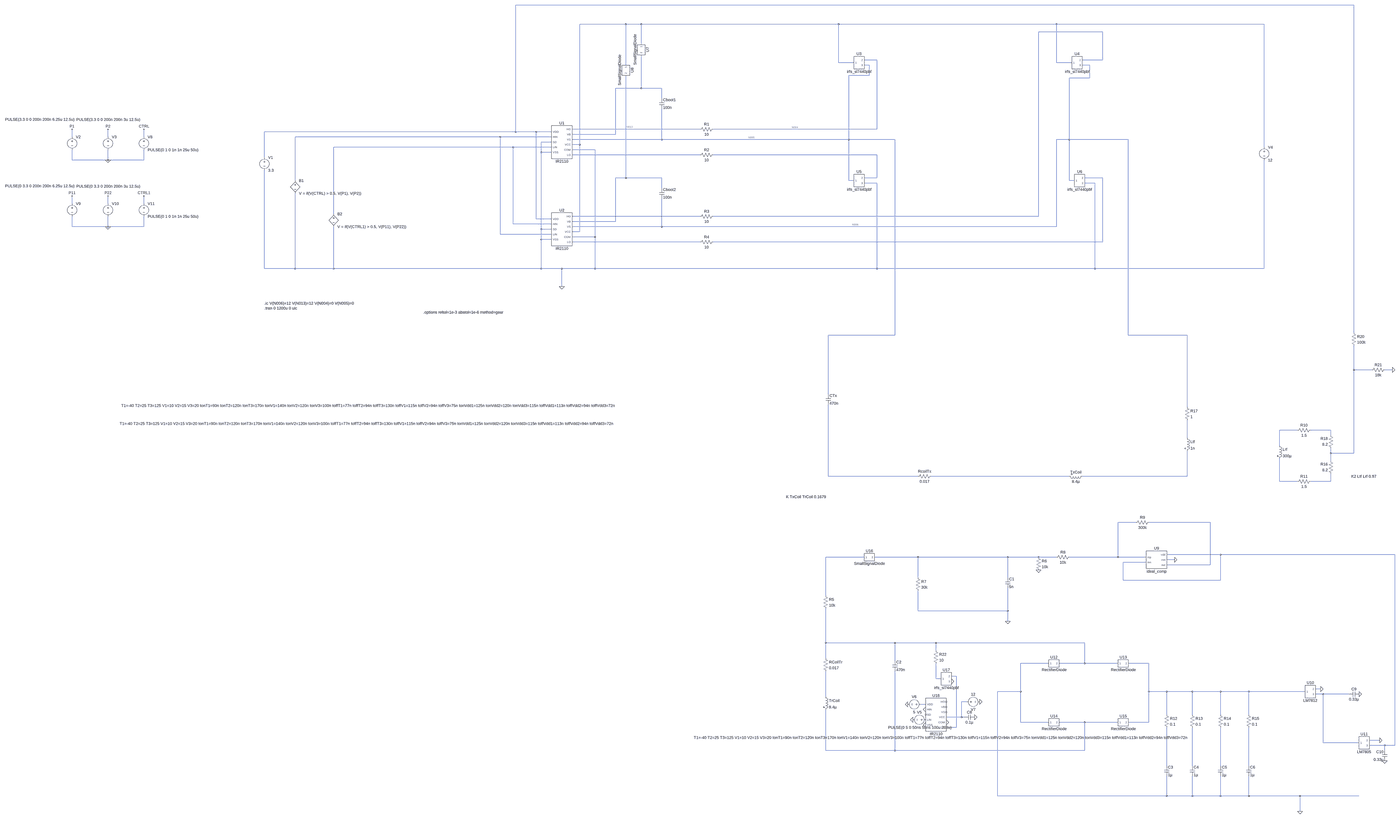
[diagram p0: schematic Circuit_8dec.asc, whole sheet]
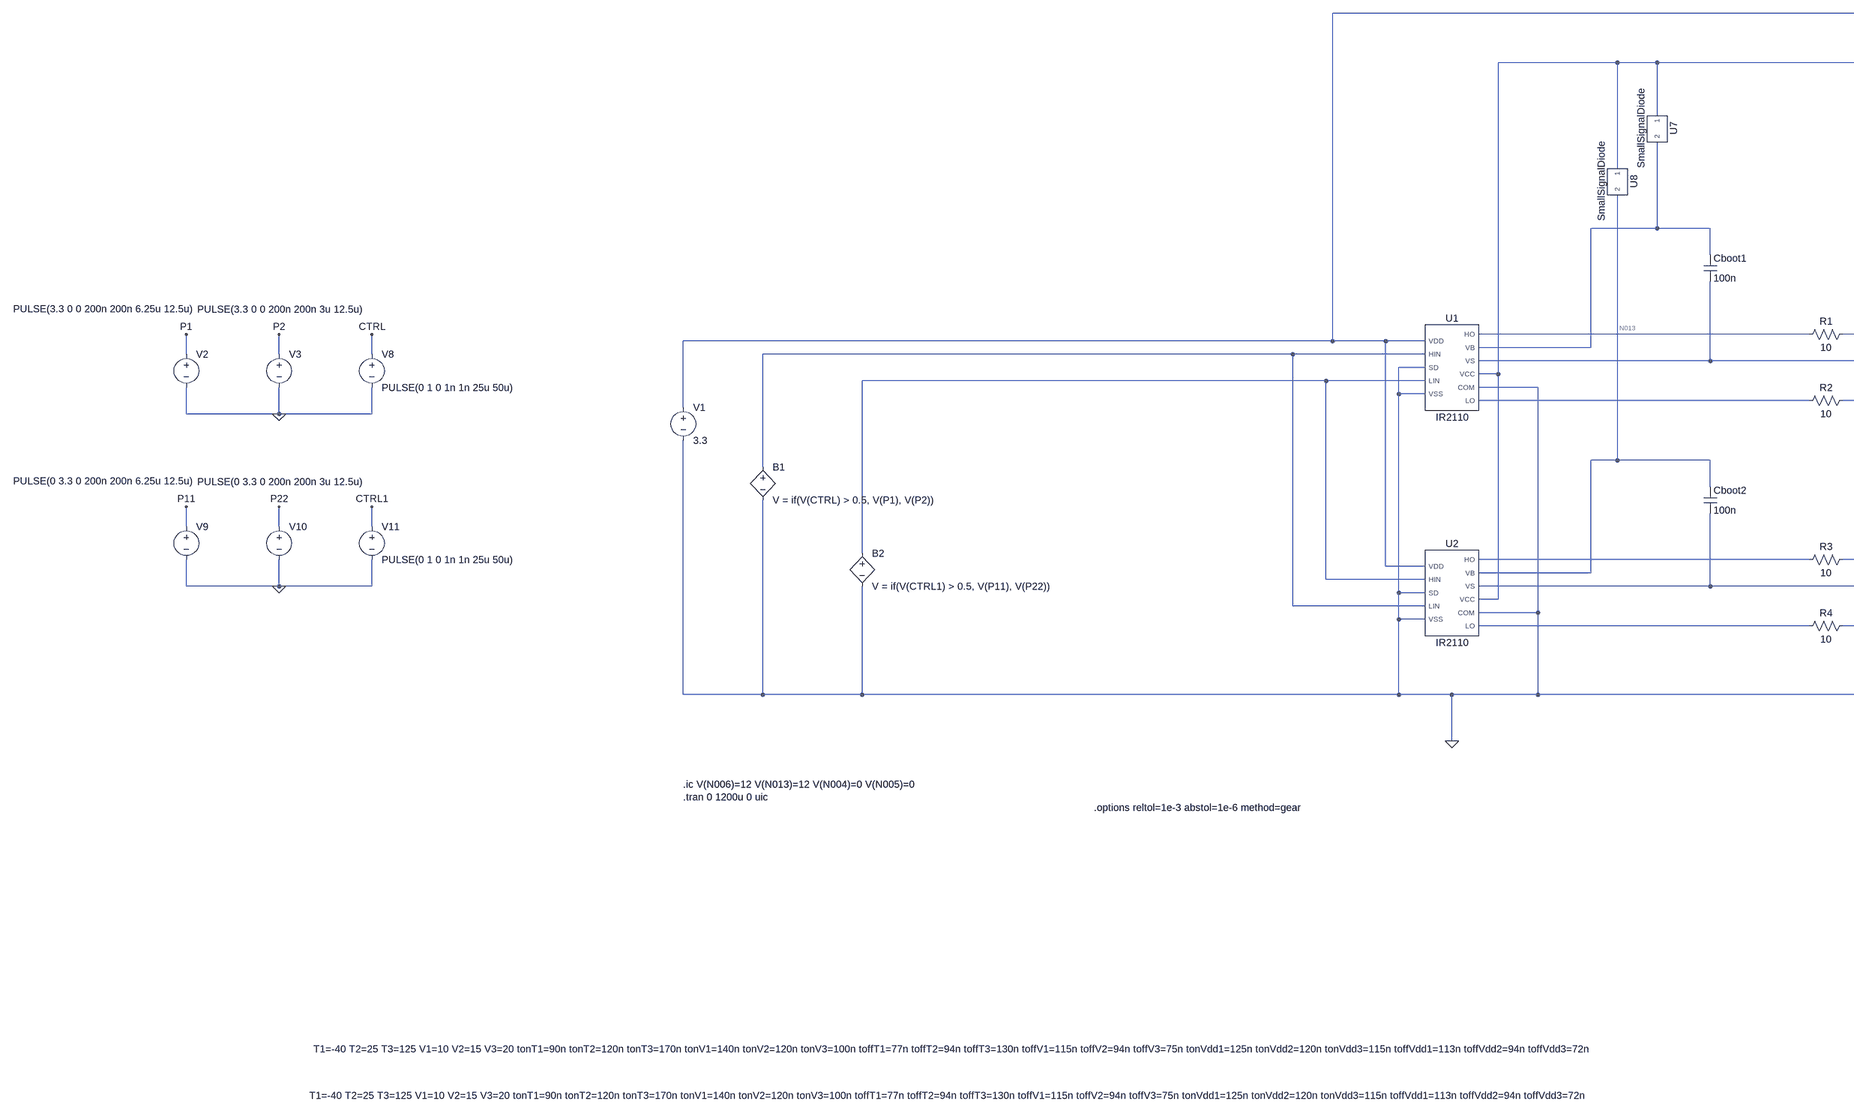
[diagram p1: schematic Circuit_8dec.asc, part, row 1 of 2, column 1 of 2]
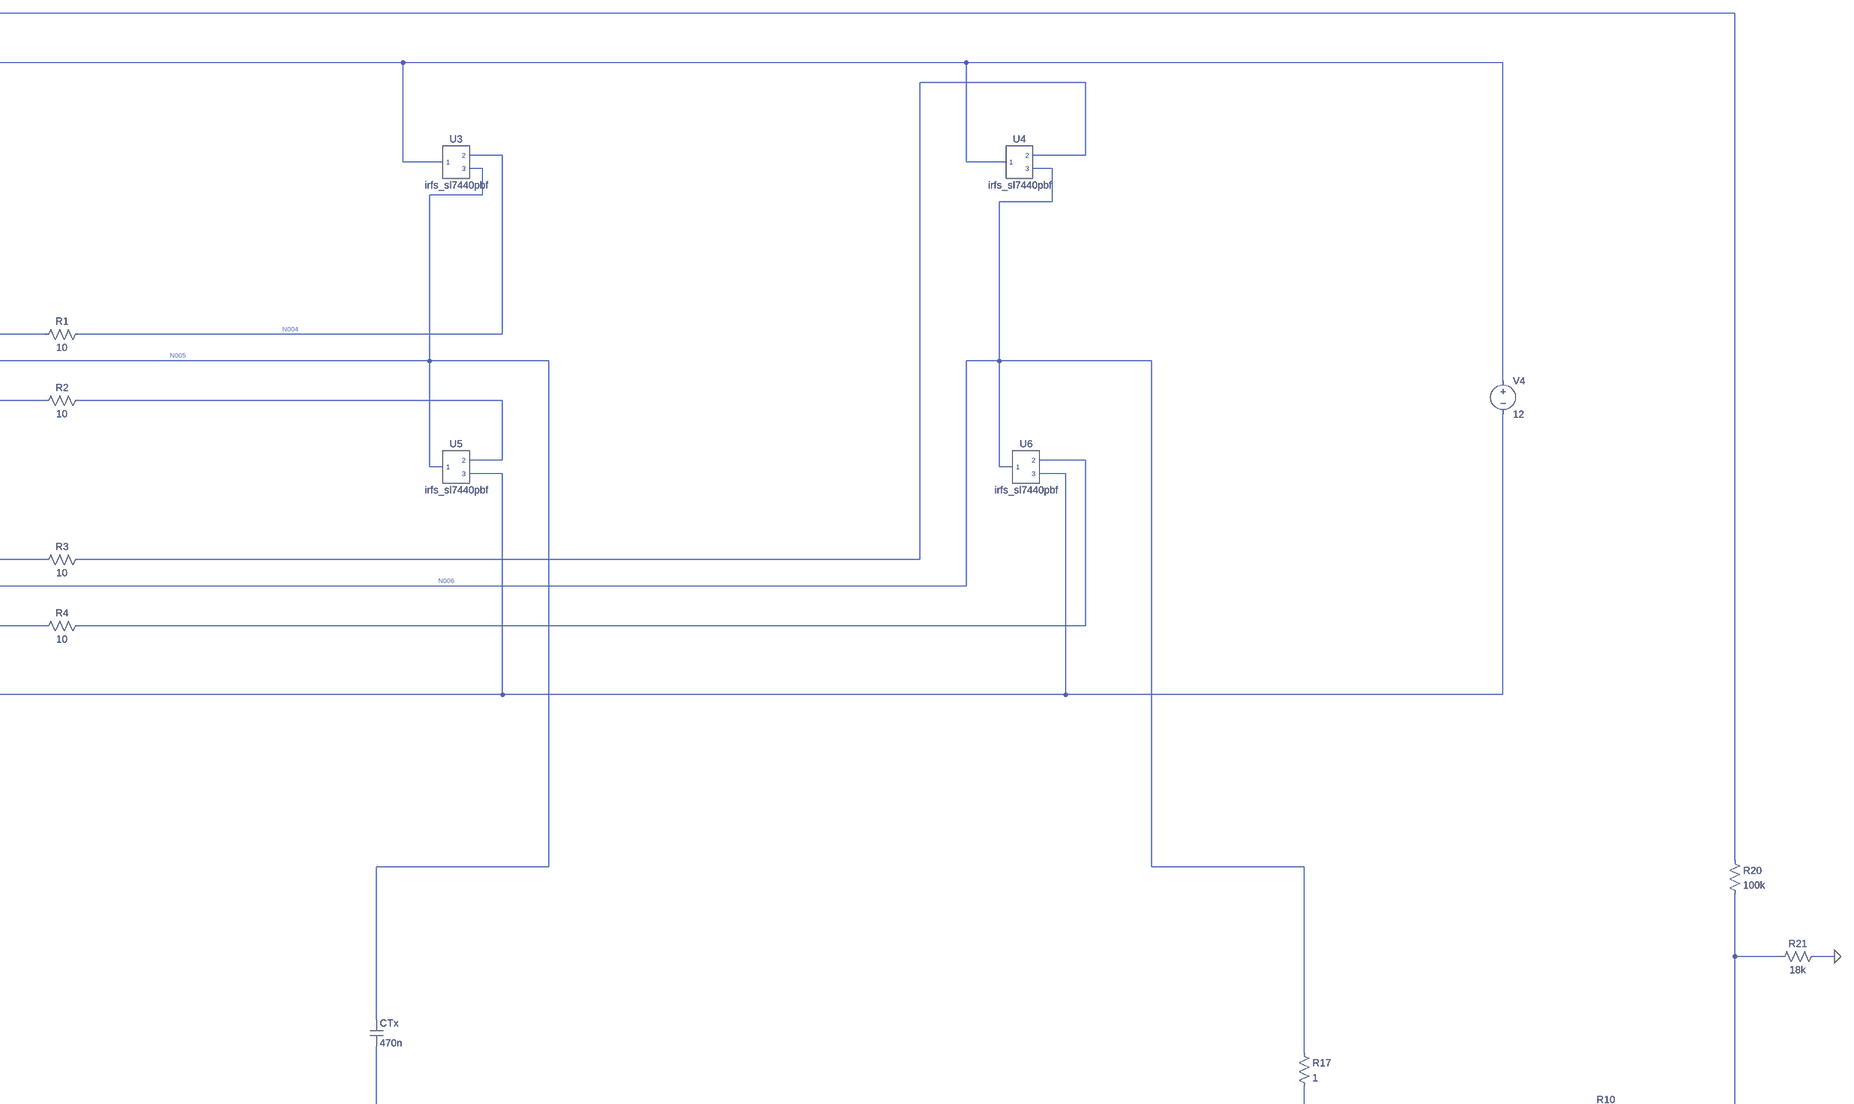
[diagram p2: schematic Circuit_8dec.asc, part, row 1 of 2, column 2 of 2]
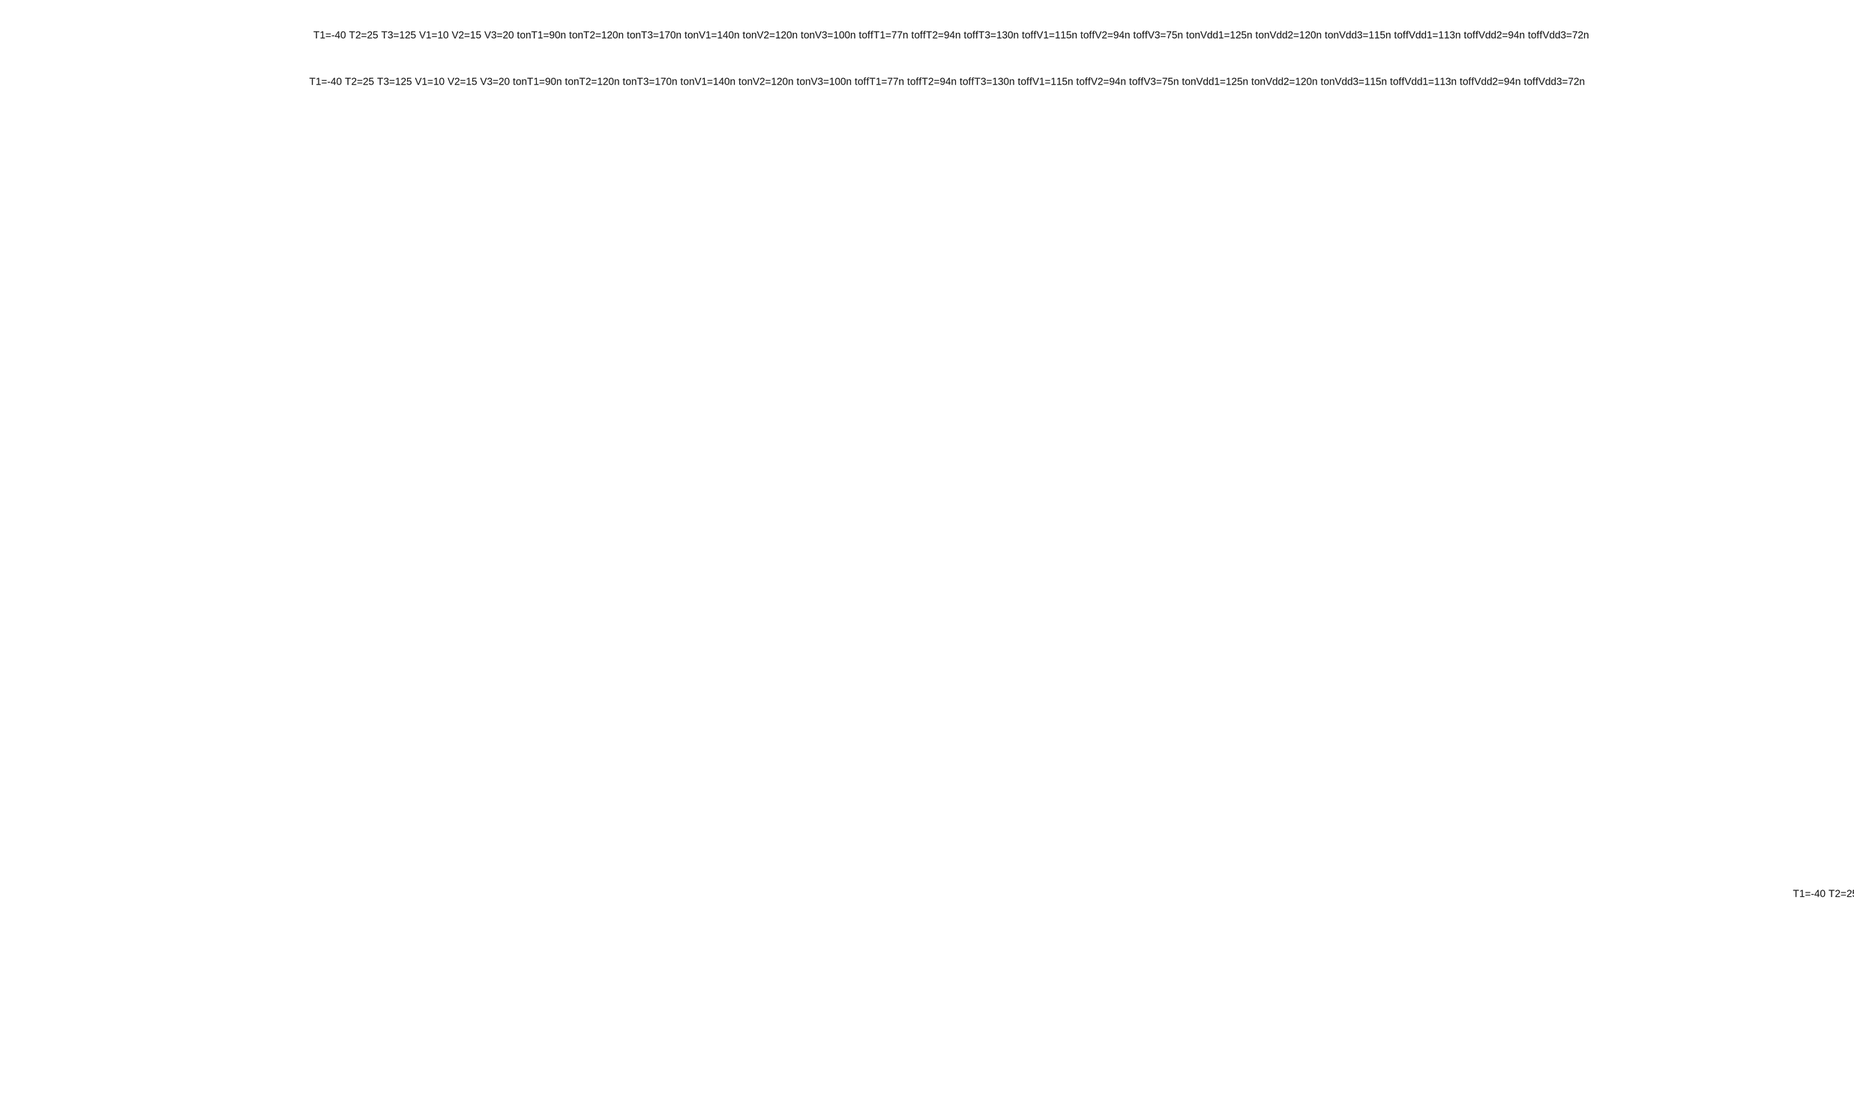
[diagram p3: schematic Circuit_8dec.asc, part, row 2 of 2, column 1 of 2]
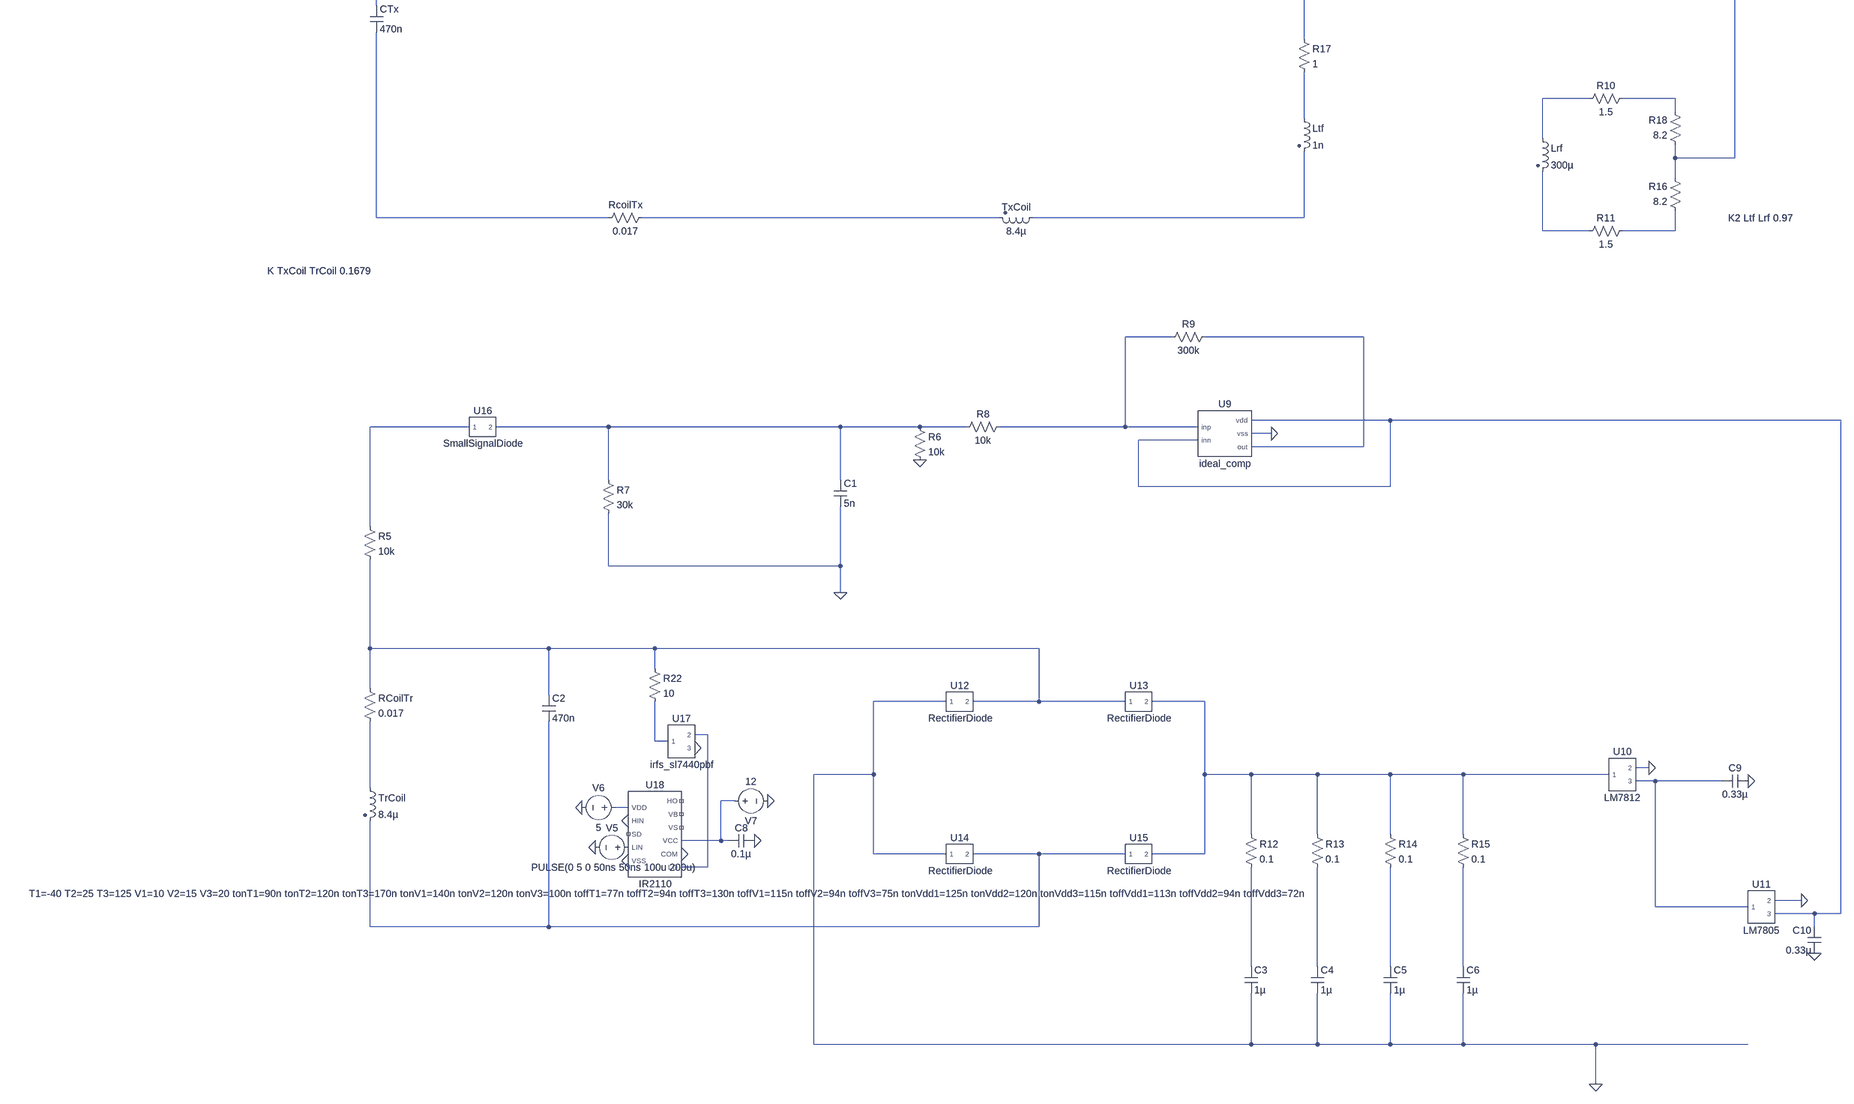
[diagram p4: schematic Circuit_8dec.asc, part, row 2 of 2, column 2 of 2]
Circuit_8dec.asc, the LTspice schematic file:
Version 4.1
SHEET 1 5604 5188
WIRE 5136 -896 -144 -896
WIRE 544 -688 256 -688
WIRE 640 -688 544 -688
WIRE 1920 -688 640 -688
WIRE 3280 -688 1920 -688
WIRE 4576 -688 3280 -688
WIRE 3568 -640 3168 -640
WIRE 640 -560 640 -688
WIRE 2160 -464 2080 -464
WIRE 3568 -464 3568 -640
WIRE 3568 -464 3440 -464
WIRE 1920 -448 1920 -688
WIRE 2016 -448 1920 -448
WIRE 3280 -448 3280 -688
WIRE 3376 -448 3280 -448
WIRE 544 -432 544 -688
WIRE 2112 -432 2080 -432
WIRE 3488 -432 3440 -432
WIRE 2112 -368 2112 -432
WIRE 2112 -368 1984 -368
WIRE 3488 -352 3488 -432
WIRE 3488 -352 3360 -352
WIRE 640 -288 640 -496
WIRE 640 -288 480 -288
WIRE 768 -288 640 -288
WIRE 768 -224 768 -288
WIRE 1056 -32 208 -32
WIRE 2160 -32 2160 -464
WIRE 2160 -32 1136 -32
WIRE -144 -16 -144 -896
WIRE -144 -16 -1712 -16
WIRE -16 -16 -144 -16
WIRE 80 -16 -16 -16
WIRE 480 0 480 -288
WIRE 480 0 208 0
WIRE -2912 16 -2912 -32
WIRE -2688 16 -2688 -32
WIRE -2464 16 -2464 -32
WIRE -240 16 -1520 16
WIRE 80 16 -240 16
WIRE 768 32 768 -160
WIRE 768 32 208 32
WIRE 1984 32 1984 -368
WIRE 1984 32 768 32
WIRE 2272 32 1984 32
WIRE 3360 32 3360 -352
WIRE 3360 32 3280 32
WIRE 3728 32 3360 32
WIRE 80 48 16 48
WIRE 256 64 256 -688
WIRE 256 64 208 64
WIRE -160 80 -1280 80
WIRE 80 80 -160 80
WIRE 4576 80 4576 -688
WIRE 352 96 208 96
WIRE 16 112 16 48
WIRE 80 112 16 112
WIRE 1056 128 208 128
WIRE 2160 128 1136 128
WIRE -1712 144 -1712 -16
WIRE -2912 160 -2912 96
WIRE -2688 160 -2688 96
WIRE -2688 160 -2912 160
WIRE -2464 160 -2464 96
WIRE -2464 160 -2688 160
WIRE 544 272 544 -368
WIRE 544 272 480 272
WIRE 768 272 544 272
WIRE 2160 272 2160 128
WIRE 2160 272 2080 272
WIRE 3568 272 3456 272
WIRE -1520 288 -1520 16
WIRE 1984 288 1984 32
WIRE 2016 288 1984 288
WIRE 3360 288 3360 32
WIRE 3392 288 3360 288
WIRE 2160 304 2080 304
WIRE 3520 304 3456 304
WIRE 768 336 768 272
WIRE -2912 432 -2912 384
WIRE -2688 432 -2688 384
WIRE -2464 432 -2464 384
WIRE -1280 496 -1280 80
WIRE 1056 512 208 512
WIRE 3168 512 3168 -640
WIRE 3168 512 1136 512
WIRE -16 528 -16 -16
WIRE 80 528 -16 528
WIRE 480 544 480 272
WIRE 480 544 208 544
WIRE -160 560 -160 80
WIRE 80 560 -160 560
WIRE -2912 576 -2912 512
WIRE -2688 576 -2688 512
WIRE -2688 576 -2912 576
WIRE -2464 576 -2464 512
WIRE -2464 576 -2688 576
WIRE 768 576 768 400
WIRE 768 576 208 576
WIRE 3280 576 3280 32
WIRE 3280 576 768 576
WIRE 16 592 16 112
WIRE 80 592 16 592
WIRE 256 608 256 64
WIRE 256 608 208 608
WIRE -240 624 -240 16
WIRE 80 624 -240 624
WIRE 352 640 352 96
WIRE 352 640 208 640
WIRE 16 656 16 592
WIRE 80 656 16 656
WIRE 1056 672 208 672
WIRE 3568 672 3568 272
WIRE 3568 672 1136 672
WIRE -1712 1008 -1712 224
WIRE -1520 1008 -1520 368
WIRE -1520 1008 -1712 1008
WIRE -1280 1008 -1280 576
WIRE -1280 1008 -1520 1008
WIRE 16 1008 16 656
WIRE 16 1008 -1280 1008
WIRE 144 1008 16 1008
WIRE 352 1008 352 640
WIRE 352 1008 144 1008
WIRE 2160 1008 2160 304
WIRE 2160 1008 352 1008
WIRE 3520 1008 3520 304
WIRE 3520 1008 2160 1008
WIRE 4576 1008 4576 160
WIRE 4576 1008 3520 1008
WIRE 144 1120 144 1008
WIRE 5136 1616 5136 -896
WIRE 2272 1632 2272 32
WIRE 2272 1632 1856 1632
WIRE 3728 1632 3728 32
WIRE 4096 1632 3728 1632
WIRE 5136 1888 5136 1696
WIRE 5248 1888 5136 1888
WIRE 5376 1888 5328 1888
WIRE 1856 2048 1856 1632
WIRE 4096 2128 4096 1632
WIRE 4784 2272 4672 2272
WIRE 4992 2272 4864 2272
WIRE 4992 2304 4992 2272
WIRE 4096 2320 4096 2208
WIRE 4672 2368 4672 2272
WIRE 4992 2416 4992 2384
WIRE 5136 2416 5136 1888
WIRE 5136 2416 4992 2416
WIRE 4992 2464 4992 2416
WIRE 1856 2560 1856 2112
WIRE 2416 2560 1856 2560
WIRE 3360 2560 2496 2560
WIRE 4096 2560 4096 2400
WIRE 4096 2560 3440 2560
WIRE 4672 2592 4672 2448
WIRE 4784 2592 4672 2592
WIRE 4992 2592 4992 2544
WIRE 4992 2592 4864 2592
WIRE 3776 2864 3664 2864
WIRE 4240 2864 3856 2864
WIRE 4304 3152 3968 3152
WIRE 5392 3152 4304 3152
WIRE 2080 3168 1840 3168
WIRE 2416 3168 2144 3168
WIRE 2976 3168 2416 3168
WIRE 3168 3168 2976 3168
WIRE 3280 3168 3168 3168
WIRE 3664 3168 3664 2864
WIRE 3664 3168 3360 3168
WIRE 3840 3168 3664 3168
WIRE 4016 3184 3968 3184
WIRE 3840 3200 3696 3200
WIRE 4240 3216 4240 2864
WIRE 4240 3216 3968 3216
WIRE 2416 3296 2416 3168
WIRE 2976 3296 2976 3168
WIRE 3696 3312 3696 3200
WIRE 4304 3312 4304 3152
WIRE 4304 3312 3696 3312
WIRE 1840 3408 1840 3168
WIRE 2416 3504 2416 3376
WIRE 2976 3504 2976 3360
WIRE 2976 3504 2416 3504
WIRE 2976 3568 2976 3504
WIRE 1840 3904 1840 3488
WIRE 2272 3904 1840 3904
WIRE 2528 3904 2272 3904
WIRE 3456 3904 2528 3904
WIRE 2528 3952 2528 3904
WIRE 1840 4000 1840 3904
WIRE 2272 4016 2272 3904
WIRE 3232 4032 3056 4032
WIRE 3456 4032 3456 3904
WIRE 3456 4032 3296 4032
WIRE 3664 4032 3456 4032
WIRE 3856 4032 3728 4032
WIRE 2656 4112 2624 4112
WIRE 2528 4128 2528 4032
WIRE 2560 4128 2528 4128
WIRE 4928 4192 4896 4192
WIRE 3056 4208 3056 4032
WIRE 3056 4208 2912 4208
WIRE 3856 4208 3856 4032
WIRE 3968 4208 3856 4208
WIRE 4128 4208 3968 4208
WIRE 4304 4208 4128 4208
WIRE 4480 4208 4304 4208
WIRE 4832 4208 4480 4208
WIRE 4944 4224 4896 4224
WIRE 5104 4224 4944 4224
WIRE 1840 4240 1840 4080
WIRE 2720 4272 2688 4272
WIRE 2464 4288 2432 4288
WIRE 3968 4352 3968 4208
WIRE 4128 4352 4128 4208
WIRE 4304 4352 4304 4208
WIRE 4480 4352 4480 4208
WIRE 2688 4368 2688 4272
WIRE 2688 4368 2592 4368
WIRE 2704 4368 2688 4368
WIRE 3056 4400 3056 4208
WIRE 3232 4400 3056 4400
WIRE 3456 4400 3296 4400
WIRE 3664 4400 3456 4400
WIRE 3856 4400 3856 4208
WIRE 3856 4400 3728 4400
WIRE 2656 4432 2656 4112
WIRE 2656 4432 2592 4432
WIRE 5296 4512 5232 4512
WIRE 4944 4528 4944 4224
WIRE 5168 4528 4944 4528
WIRE 5328 4544 5232 4544
WIRE 5392 4544 5392 3152
WIRE 5392 4544 5328 4544
WIRE 1840 4576 1840 4320
WIRE 2272 4576 2272 4080
WIRE 2272 4576 1840 4576
WIRE 3456 4576 3456 4400
WIRE 3456 4576 2272 4576
WIRE 5328 4576 5328 4544
WIRE 3968 4672 3968 4432
WIRE 4128 4672 4128 4432
WIRE 4304 4672 4304 4432
WIRE 4480 4672 4480 4432
WIRE 2912 4896 2912 4208
WIRE 3968 4896 3968 4736
WIRE 3968 4896 2912 4896
WIRE 4128 4896 4128 4736
WIRE 4128 4896 3968 4896
WIRE 4304 4896 4304 4736
WIRE 4304 4896 4128 4896
WIRE 4480 4896 4480 4736
WIRE 4480 4896 4304 4896
WIRE 4800 4896 4480 4896
WIRE 5168 4896 4800 4896
WIRE 4800 4992 4800 4896
FLAG 144 1120 0
FLAG 2976 3568 0
FLAG 4016 3184 0
FLAG 4800 4992 0
FLAG 4928 4192 0
FLAG 5296 4512 0
FLAG 5376 1888 0
FLAG 2624 4144 0
FLAG 2592 4400 0
FLAG 2768 4368 0
FLAG 2384 4384 0
FLAG 2352 4288 0
FLAG 2800 4272 0
FLAG 2464 4416 0
FLAG 5168 4224 0
FLAG 5328 4640 0
FLAG 3168 3248 0
FLAG 2464 4320 0
FLAG -2688 160 0
FLAG -2912 -32 P1
FLAG -2688 -32 P2
FLAG -2464 -32 CTRL
FLAG -2688 576 0
FLAG -2912 384 P11
FLAG -2688 384 P22
FLAG -2464 384 CTRL1
SYMBOL IR2110 144 48 R0
WINDOW 39 -1247 2167 Top 2
SYMATTR InstName U1
SYMBOL IR2110 144 592 R0
WINDOW 39 -1237 1511 Top 2
SYMATTR InstName U2
SYMBOL voltage -1712 128 R0
SYMATTR InstName V1
SYMATTR Value 3.3
SYMBOL irfs_sl7440pbf 2048 -448 R0
SYMATTR InstName U3
SYMBOL irfs_sl7440pbf 3408 -448 R0
SYMATTR InstName U4
SYMBOL irfs_sl7440pbf 2048 288 R0
SYMATTR InstName U5
SYMBOL irfs_sl7440pbf 3424 288 R0
SYMATTR InstName U6
SYMBOL voltage 4576 64 R0
SYMATTR InstName V4
SYMATTR Value 12
SYMBOL cap 752 -224 R0
SYMATTR InstName Cboot1
SYMATTR Value 100n
SYMBOL cap 752 336 R0
SYMATTR InstName Cboot2
SYMATTR Value 100n
SYMBOL res 1152 -48 R90
WINDOW 0 0 56 VBottom 2
WINDOW 3 32 56 VTop 2
SYMATTR InstName R1
SYMATTR Value 10
SYMBOL res 1152 112 R90
WINDOW 0 0 56 VBottom 2
WINDOW 3 32 56 VTop 2
SYMATTR InstName R2
SYMATTR Value 10
SYMBOL res 1152 496 R90
WINDOW 0 0 56 VBottom 2
WINDOW 3 32 56 VTop 2
SYMATTR InstName R3
SYMATTR Value 10
SYMBOL res 1152 656 R90
WINDOW 0 0 56 VBottom 2
WINDOW 3 32 56 VTop 2
SYMATTR InstName R4
SYMATTR Value 10
SYMBOL SmallSignalDiode 640 -528 R90
SYMATTR InstName U7
SYMBOL SmallSignalDiode 544 -400 R90
SYMATTR InstName U8
SYMBOL cap 1840 2048 R0
SYMATTR InstName CTx
SYMATTR Value 470n
SYMBOL res 2512 2544 R90
WINDOW 0 0 56 VBottom 2
WINDOW 3 32 56 VTop 2
SYMATTR InstName RcoilTx
SYMATTR Value 0.017
SYMBOL ind2 3456 2544 R90
WINDOW 0 5 56 VBottom 2
WINDOW 3 32 56 VTop 2
SYMATTR InstName TxCoil
SYMATTR Value 8.4µ
SYMATTR Type ind
SYMBOL ind2 1824 4224 R0
SYMATTR InstName TrCoil
SYMATTR Value 8.4µ
SYMATTR Type ind
SYMBOL res 1824 3392 R0
SYMATTR InstName R5
SYMATTR Value 10k
SYMBOL res 2400 3280 R0
SYMATTR InstName R7
SYMATTR Value 30k
SYMBOL cap 2960 3296 R0
SYMATTR InstName C1
SYMATTR Value 5n
SYMBOL res 3376 3152 R90
WINDOW 0 0 56 VBottom 2
WINDOW 3 32 56 VTop 2
SYMATTR InstName R8
SYMATTR Value 10k
SYMBOL res 3872 2848 R90
WINDOW 0 0 56 VBottom 2
WINDOW 3 32 56 VTop 2
SYMATTR InstName R9
SYMATTR Value 300k
SYMBOL ideal_comp 3904 3184 R0
SYMATTR InstName U9
SYMBOL cap 2256 4016 R0
SYMATTR InstName C2
SYMATTR Value 470n
SYMBOL res 3952 4336 R0
SYMATTR InstName R12
SYMATTR Value 0.1
SYMBOL res 4112 4336 R0
SYMATTR InstName R13
SYMATTR Value 0.1
SYMBOL res 4288 4336 R0
SYMATTR InstName R14
SYMATTR Value 0.1
SYMBOL res 4464 4336 R0
SYMATTR InstName R15
SYMATTR Value 0.1
SYMBOL cap 3952 4672 R0
SYMATTR InstName C3
SYMATTR Value 1µ
SYMBOL cap 4112 4672 R0
SYMATTR InstName C4
SYMATTR Value 1µ
SYMBOL cap 4288 4672 R0
SYMATTR InstName C5
SYMATTR Value 1µ
SYMBOL cap 4464 4672 R0
SYMATTR InstName C6
SYMATTR Value 1µ
SYMBOL LM7812 4864 4208 R0
SYMATTR InstName U10
SYMBOL LM7805 5200 4528 R0
SYMATTR InstName U11
SYMBOL RectifierDiode 3264 4032 R0
SYMATTR InstName U12
SYMBOL RectifierDiode 3696 4032 R0
SYMATTR InstName U13
SYMBOL RectifierDiode 3264 4400 R0
SYMATTR InstName U14
SYMBOL RectifierDiode 3696 4400 R0
SYMATTR InstName U15
SYMBOL SmallSignalDiode 2112 3168 R0
SYMATTR InstName U16
SYMBOL res 1824 3984 R0
SYMATTR InstName RCoilTr
SYMATTR Value 0.017
SYMBOL res 4080 2112 R0
SYMATTR InstName R17
SYMATTR Value 1
SYMBOL ind2 4080 2304 R0
SYMATTR InstName Ltf
SYMATTR Value 1n
SYMATTR Type ind
SYMBOL ind2 4656 2352 R0
SYMATTR InstName Lrf
SYMATTR Value 300µ
SYMATTR Type ind
SYMBOL Res 5120 1600 R0
SYMATTR InstName R20
SYMATTR Value 100k
SYMBOL Res 5344 1872 R90
WINDOW 0 0 56 VBottom 2
WINDOW 3 32 56 VTop 2
SYMATTR InstName R21
SYMATTR Value 18k
SYMBOL irfs_sl7440pbf 2592 4128 R0
SYMATTR InstName U17
SYMBOL res 2512 3936 R0
SYMATTR InstName R22
SYMATTR Value 10
SYMBOL IR2110 2528 4352 R0
SYMATTR InstName U18
SYMBOL cap 2768 4352 R90
WINDOW 0 0 32 VBottom 2
WINDOW 3 32 32 VTop 2
SYMATTR InstName C8
SYMATTR Value 0.1µ
SYMBOL voltage 2480 4384 R90
WINDOW 0 -32 56 VBottom 2
WINDOW 3 32 56 VTop 2
WINDOW 123 0 0 Left 0
WINDOW 39 0 0 Left 0
SYMATTR InstName V5
SYMATTR Value PULSE(0 5 0 50ns 50ns 100u 200u)
SYMBOL voltage 2448 4288 R90
WINDOW 0 -32 56 VBottom 2
WINDOW 3 32 56 VTop 2
WINDOW 123 0 0 Left 0
WINDOW 39 0 0 Left 0
SYMATTR InstName V6
SYMATTR Value 5
SYMBOL voltage 2704 4272 R270
WINDOW 0 -32 56 VBottom 2
WINDOW 3 32 56 VTop 2
WINDOW 123 0 0 Left 0
WINDOW 39 0 0 Left 0
SYMATTR InstName V7
SYMATTR Value 12
SYMBOL cap 5168 4208 R90
WINDOW 0 0 32 VBottom 2
WINDOW 3 32 32 VTop 2
SYMATTR InstName C9
SYMATTR Value 0.33µ
SYMBOL cap 5344 4640 R180
WINDOW 0 24 56 Left 2
WINDOW 3 24 8 Left 2
SYMATTR InstName C10
SYMATTR Value 0.33µ
SYMBOL res 3152 3152 R0
SYMATTR InstName R6
SYMATTR Value 10k
SYMBOL res 4880 2256 R90
WINDOW 0 0 56 VBottom 2
WINDOW 3 32 56 VTop 2
SYMATTR InstName R10
SYMATTR Value 1.5
SYMBOL res 4880 2576 R90
WINDOW 0 0 56 VBottom 2
WINDOW 3 32 56 VTop 2
SYMATTR InstName R11
SYMATTR Value 1.5
SYMBOL res 5008 2560 R180
WINDOW 0 36 76 Left 2
WINDOW 3 36 40 Left 2
SYMATTR InstName R16
SYMATTR Value 8.2
SYMBOL res 5008 2400 R180
WINDOW 0 36 76 Left 2
WINDOW 3 36 40 Left 2
SYMATTR InstName R18
SYMATTR Value 8.2
SYMBOL voltage -2912 0 R0
WINDOW 3 -418 -94 Left 2
SYMATTR InstName V2
SYMATTR Value PULSE(3.3 0 0 200n 200n 6.25u 12.5u)
SYMBOL voltage -2688 0 R0
WINDOW 3 -197 -93 Left 2
SYMATTR InstName V3
SYMATTR Value PULSE(3.3 0 0 200n 200n 3u 12.5u)
SYMBOL voltage -2464 0 R0
SYMATTR InstName V8
SYMATTR Value PULSE(0 1 0 1n 1n 25u 50u)
SYMBOL bv -1520 272 R0
SYMATTR InstName B1
SYMATTR Value V = if(V(CTRL) > 0.5, V(P1), V(P2))
SYMBOL bv -1280 480 R0
SYMATTR InstName B2
SYMATTR Value V = if(V(CTRL1) > 0.5, V(P11), V(P22))
SYMBOL voltage -2912 416 R0
WINDOW 3 -418 -94 Left 2
SYMATTR InstName V9
SYMATTR Value PULSE(0 3.3 0 200n 200n 6.25u 12.5u)
SYMBOL voltage -2688 416 R0
WINDOW 3 -197 -93 Left 2
SYMATTR InstName V10
SYMATTR Value PULSE(0 3.3 0 200n 200n 3u 12.5u)
SYMBOL voltage -2464 416 R0
SYMATTR InstName V11
SYMATTR Value PULSE(0 1 0 1n 1n 25u 50u)
TEXT -720 1280 Left 2 !.options reltol=1e-3 abstol=1e-6 method=gear
TEXT -1712 1224 Left 2 !.ic V(N006)=12 V(N013)=12 V(N004)=0 V(N005)=0\n.tran 0 1200u 0 uic
TEXT 1592 2688 Left 2 !K TxCoil TrCoil 0.1679
TEXT 5120 2560 Left 2 !K2 Ltf Lrf 0.97

The netlist it stands for:
* Circuit_8dec.asc
X§U1 N001 N009 0 N010 0 N008 N007 N005 N002 0 N011 IR2110 T1=-40 T2=25 T3=125 V1=10 V2=15 V3=20 tonT1=90n tonT2=120n tonT3=170n tonV1=140n tonV2=120n tonV3=100n toffT1=77n toffT2=94n toffT3=130n toffV1=115n toffV2=94n toffV3=75n tonVdd1=125n tonVdd2=120n tonVdd3=115n toffVdd1=113n toffVdd2=94n toffVdd3=72n  ; pins VDD HIN SD LIN VSS HO VB VS VCC COM LO
X§U2 N001 N010 0 N009 0 N015 N013 N006 N002 0 N016 IR2110 T1=-40 T2=25 T3=125 V1=10 V2=15 V3=20 tonT1=90n tonT2=120n tonT3=170n tonV1=140n tonV2=120n tonV3=100n toffT1=77n toffT2=94n toffT3=130n toffV1=115n toffV2=94n toffV3=75n tonVdd1=125n tonVdd2=120n tonVdd3=115n toffVdd1=113n toffVdd2=94n toffVdd3=72n  ; pins VDD HIN SD LIN VSS HO VB VS VCC COM LO
V1 N001 0 3.3
X§U3 N002 N004 N005 irfs_sl7440pbf  ; pins 1 2 3
X§U4 N002 N003 N006 irfs_sl7440pbf  ; pins 1 2 3
X§U5 N005 N012 0 irfs_sl7440pbf  ; pins 1 2 3
X§U6 N006 N014 0 irfs_sl7440pbf  ; pins 1 2 3
V4 N002 0 12
Cboot1 N007 N005 100n
Cboot2 N013 N006 100n
R1 N004 N008 10
R2 N012 N011 10
R3 N003 N015 10
R4 N014 N016 10
X§U7 N002 N007 SmallSignalDiode  ; pins 1 2
X§U8 N002 N013 SmallSignalDiode  ; pins 1 2
CTx N005 N021 470n
RcoilTx N022 N021 0.017
L§TxCoil N023 N022 8.4µ
L§TrCoil N036 N039 8.4µ
R5 N029 N031 10k
R7 N030 0 30k
C1 N030 0 5n
R8 N026 N030 10k
R9 N027 N026 300k
X§U9 N026 N028 N028 0 N027 ideal_comp  ; pins inp inn vdd vss out
C2 N031 N039 470n
R12 N032 N040 0.1
R13 N032 N041 0.1
R14 N032 N042 0.1
R15 N032 N043 0.1
C3 N040 0 1µ
C4 N041 0 1µ
C5 N042 0 1µ
C6 N043 0 1µ
X§U10 N032 0 N035 LM7812  ; pins 1 2 3
X§U11 N035 0 N028 LM7805  ; pins 1 2 3
X§U12 0 N031 RectifierDiode  ; pins 1 2
X§U13 N031 N032 RectifierDiode  ; pins 1 2
X§U14 0 N039 RectifierDiode  ; pins 1 2
X§U15 N039 N032 RectifierDiode  ; pins 1 2
X§U16 N029 N030 SmallSignalDiode  ; pins 1 2
RCoilTr N031 N036 0.017
R17 N006 N020 1
Ltf N020 N023 1n
Lrf N018 N024 300µ
R20 N001 N017 100k
R21 0 N017 18k
X§U17 N034 N033 0 irfs_sl7440pbf  ; pins 1 2 3
R22 N031 N034 10
X§U18 N038 0 NC_01 P001 0 NC_02 NC_03 NC_04 N037 0 N033 IR2110 T1=-40 T2=25 T3=125 V1=10 V2=15 V3=20 tonT1=90n tonT2=120n tonT3=170n tonV1=140n tonV2=120n tonV3=100n toffT1=77n toffT2=94n toffT3=130n toffV1=115n toffV2=94n toffV3=75n tonVdd1=125n tonVdd2=120n tonVdd3=115n toffVdd1=113n toffVdd2=94n toffVdd3=72n  ; pins VDD HIN SD LIN VSS HO VB VS VCC COM LO
C8 0 N037 0.1µ
V5 P001 0 PULSE(0 5 0 50ns 50ns 100u 200u)
V6 N038 0 5
V7 N037 0 12
C9 0 N035 0.33µ
C10 0 N028 0.33µ
R6 N030 0 10k
R10 N019 N018 1.5
R11 N025 N024 1.5
R16 N025 N017 8.2
R18 N017 N019 8.2
V2 P1 0 PULSE(3.3 0 0 200n 200n 6.25u 12.5u)
V3 P2 0 PULSE(3.3 0 0 200n 200n 3u 12.5u)
V8 CTRL 0 PULSE(0 1 0 1n 1n 25u 50u)
B1 N009 0 V = if(V(CTRL) > 0.5, V(P1), V(P2))
B2 N010 0 V = if(V(CTRL1) > 0.5, V(P11), V(P22))
V9 P11 0 PULSE(0 3.3 0 200n 200n 6.25u 12.5u)
V10 P22 0 PULSE(0 3.3 0 200n 200n 3u 12.5u)
V11 CTRL1 0 PULSE(0 1 0 1n 1n 25u 50u)
.options reltol=1e-3 abstol=1e-6 method=gear
.ic V(N006)=12 V(N013)=12 V(N004)=0 V(N005)=0
.tran 0 1200u 0 uic
K TxCoil TrCoil 0.1679
K2 Ltf Lrf 0.97
.lib IR2110.spi
.lib irfs_sl7440pbf.spi
.lib SmallSignalDiode.spi
.lib Ideal_comp.spi
.lib LM7812.spi
.lib LM7805.spi
.lib RectifierDiode.spi
.backanno
.end